# Altium project Sharif_EE2LAB_Project.PrjPcb
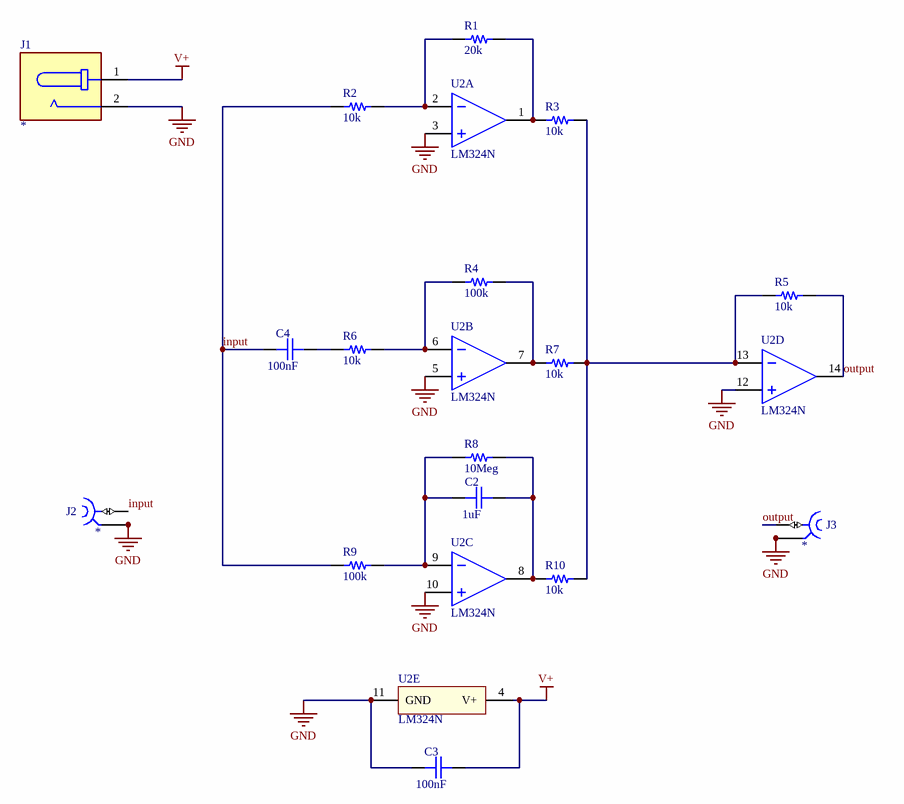
[diagram p0: Schematics.SchDoc]
1 sheet, 17 parts. Net scope: global (net labels, ports and power ports of the same name join across sheets).
Board file: PCB.PcbDoc

## Sheet Schematics.SchDoc: PID
size 297 x 209 mm; EDA_Number: EDA-XXXXX-VX-X; DivGrp: TE/MPE; CheckedBy: -; DrawnBy: DrawnBy; Organization: Sharif Institude of Technology; Revision: -; SheetNumber: 1; SheetTotal: 1; Projet: -; ModifiedBy: -; CreateDate: XX/XX/XXXX; CheckedDate: -; Title2: PROJECT; Designer: Aynaz Rezaeizadeh; SN: 402101822; ModifiedDate: -

### Parts
C2  1uF  [CAPC4720X215N]
C3  100nF  [CAPC4720X215N]
C4  100nF  [CAPC4720X215N]
J1  *  [CUI_PJ-037B]
J2  *  [LINX_CONSMA002-L-G]
J3  *  [LINX_CONSMA002-L-G]
R1  20k  [RES1016-650X250]
R2  10k  [RES1016-650X250]
R3  10k  [RES1016-650X250]
R4  100k  [RES1016-650X250]
R5  10k  [RES1016-650X250]
R6  10k  [RES1016-650X250]
R7  10k  [RES1016-650X250]
R8  10Meg  [RES1016-650X250]
R9  100k  [RES1016-650X250]
R10  10k  [RES1016-650X250]
U2  LM324N  [N0014A]  (parts A,B,C,D,E of 5)

### Nets
GND: C3.1 J1.2 J2.S1 J2.S2 J2.S3 J2.S4 J3.S1 J3.S2 J3.S3 J3.S4 U2.3(IN1+) U2.5(IN2+) U2.10(IN3+) U2.11(GND) U2.12(IN4+)
V+: C3.2 J1.1 U2.4(V+)
input: C4.1 J2.1 R2.1 R9.1
output: J3.1 R5.2 U2.14(OUT4)
NetC2_1: C2.1 R8.1 R9.2 U2.9(IN3-)
NetC2_2: C2.2 R8.2 R10.1 U2.8(OUT3)
NetC4_2: C4.2 R6.1
NetR1_1: R1.1 R2.2 U2.2(IN1-)
NetR1_2: R1.2 R3.1 U2.1(OUT1)
NetR3_2: R3.2 R5.1 R7.2 R10.2 U2.13(IN4-)
NetR4_1: R4.1 R6.2 U2.6(IN2-)
NetR4_2: R4.2 R7.1 U2.7(OUT2)

### Notes on the sheet
- Designer:
- SN:
- Print Date
- Sheet
- Size
- A4
- of
- Rev

### Library data of the parts
C2-C4 = Capacitor: Non-polarised capacitor
  C2: Value: 1uF
  C3 C4: Value: 100nF
J1 = DC Power Jack Connector: 2.5 x 6.5 mm, 2.5 A, Horizontal, Through Hole, Dc Power Jack Connector; Value: *
J2 J3 = Coax_1Female_1Shield: SMA Jack 50 Ohm PCB Through Hole; Value: *
R1-R10 = Resistor
  R1: Value: 20k
  R2 R3 R5-R7 R10: Value: 10k
  R4 R9: Value: 100k
  R8: Value: 10Meg
U2 = LM324N: Low Power Quad Operational Amplifier, 14-pin MDIP; Manufacturer: Texas Instruments; ComponentLink1Description: Datasheet URL; ComponentLink1URL: http://www.ti.com/general/docs/lit/getliterature.tsp?genericPartNumber=LM324&fileType=pdf